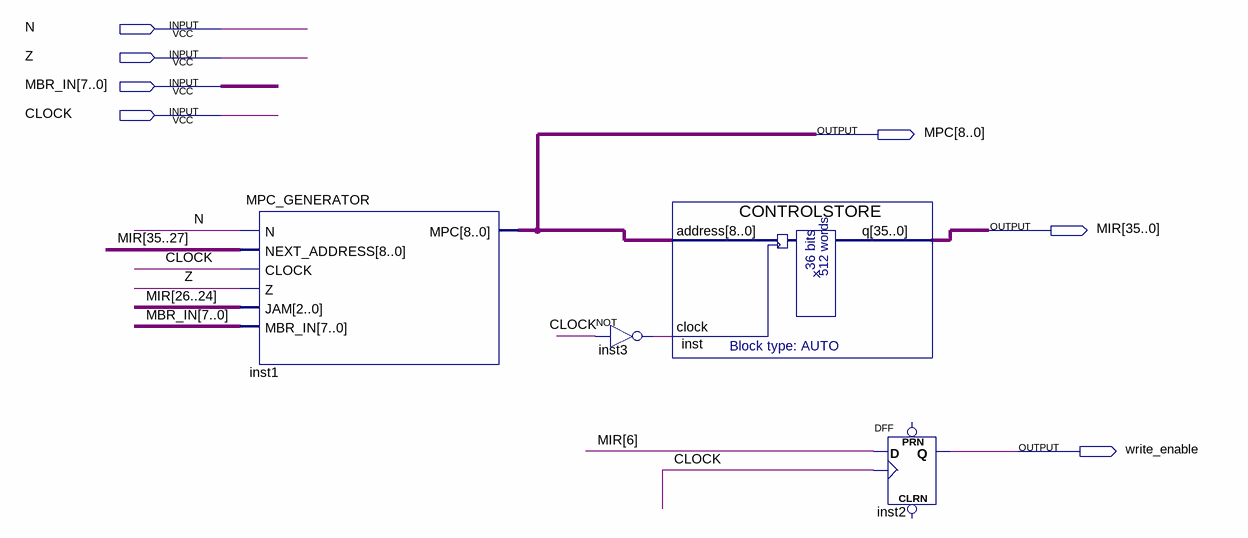
[diagram p0: schematic sheet]
// Quartus schematic CONTROL_UNIT.bdf as structural Verilog: 4 symbols, 7 pins
module CONTROL_UNIT (
  input  N,
  input  Z,
  input  [7:0] MBR_IN,
  input  CLOCK,
  output [8:0] MPC,
  output [35:0] MIR,
  output write_enable
);

  wire inst3_out;

  MPC_GENERATOR inst1 (
    .N(N), .NEXT_ADDRESS(MIR[35:27]), .CLOCK(CLOCK), .Z(Z), .JAM(MIR[26:24]), .MBR_IN(MBR_IN), .MPC(MPC));
  not inst3 (inst3_out, CLOCK);
  CONTROLSTORE inst (.address(MPC), .clock(inst3_out), .q(MIR));
  DFF inst2 (.CLK(CLOCK), .D(MIR[6]), .Q(write_enable));  // open: CLRN, PRN
endmodule
